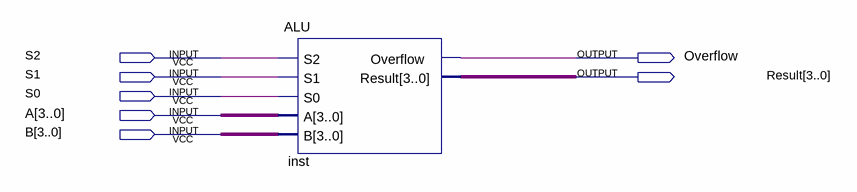
[diagram p0: schematic sheet]
// Quartus schematic cau01.bdf as structural Verilog: 1 symbols, 7 pins
module cau01 (
  input  S2,
  input  S1,
  input  S0,
  input  [3:0] A,
  input  [3:0] B,
  output Overflow,
  output [3:0] Result
);

  ALU inst (.S2(S2), .S1(S1), .S0(S0), .A(A), .B(B), .Overflow(Overflow), .Result(Result));
endmodule
